# Altium project EVLSERVO1_control_v2.PrjPcb (part 8 of 9)
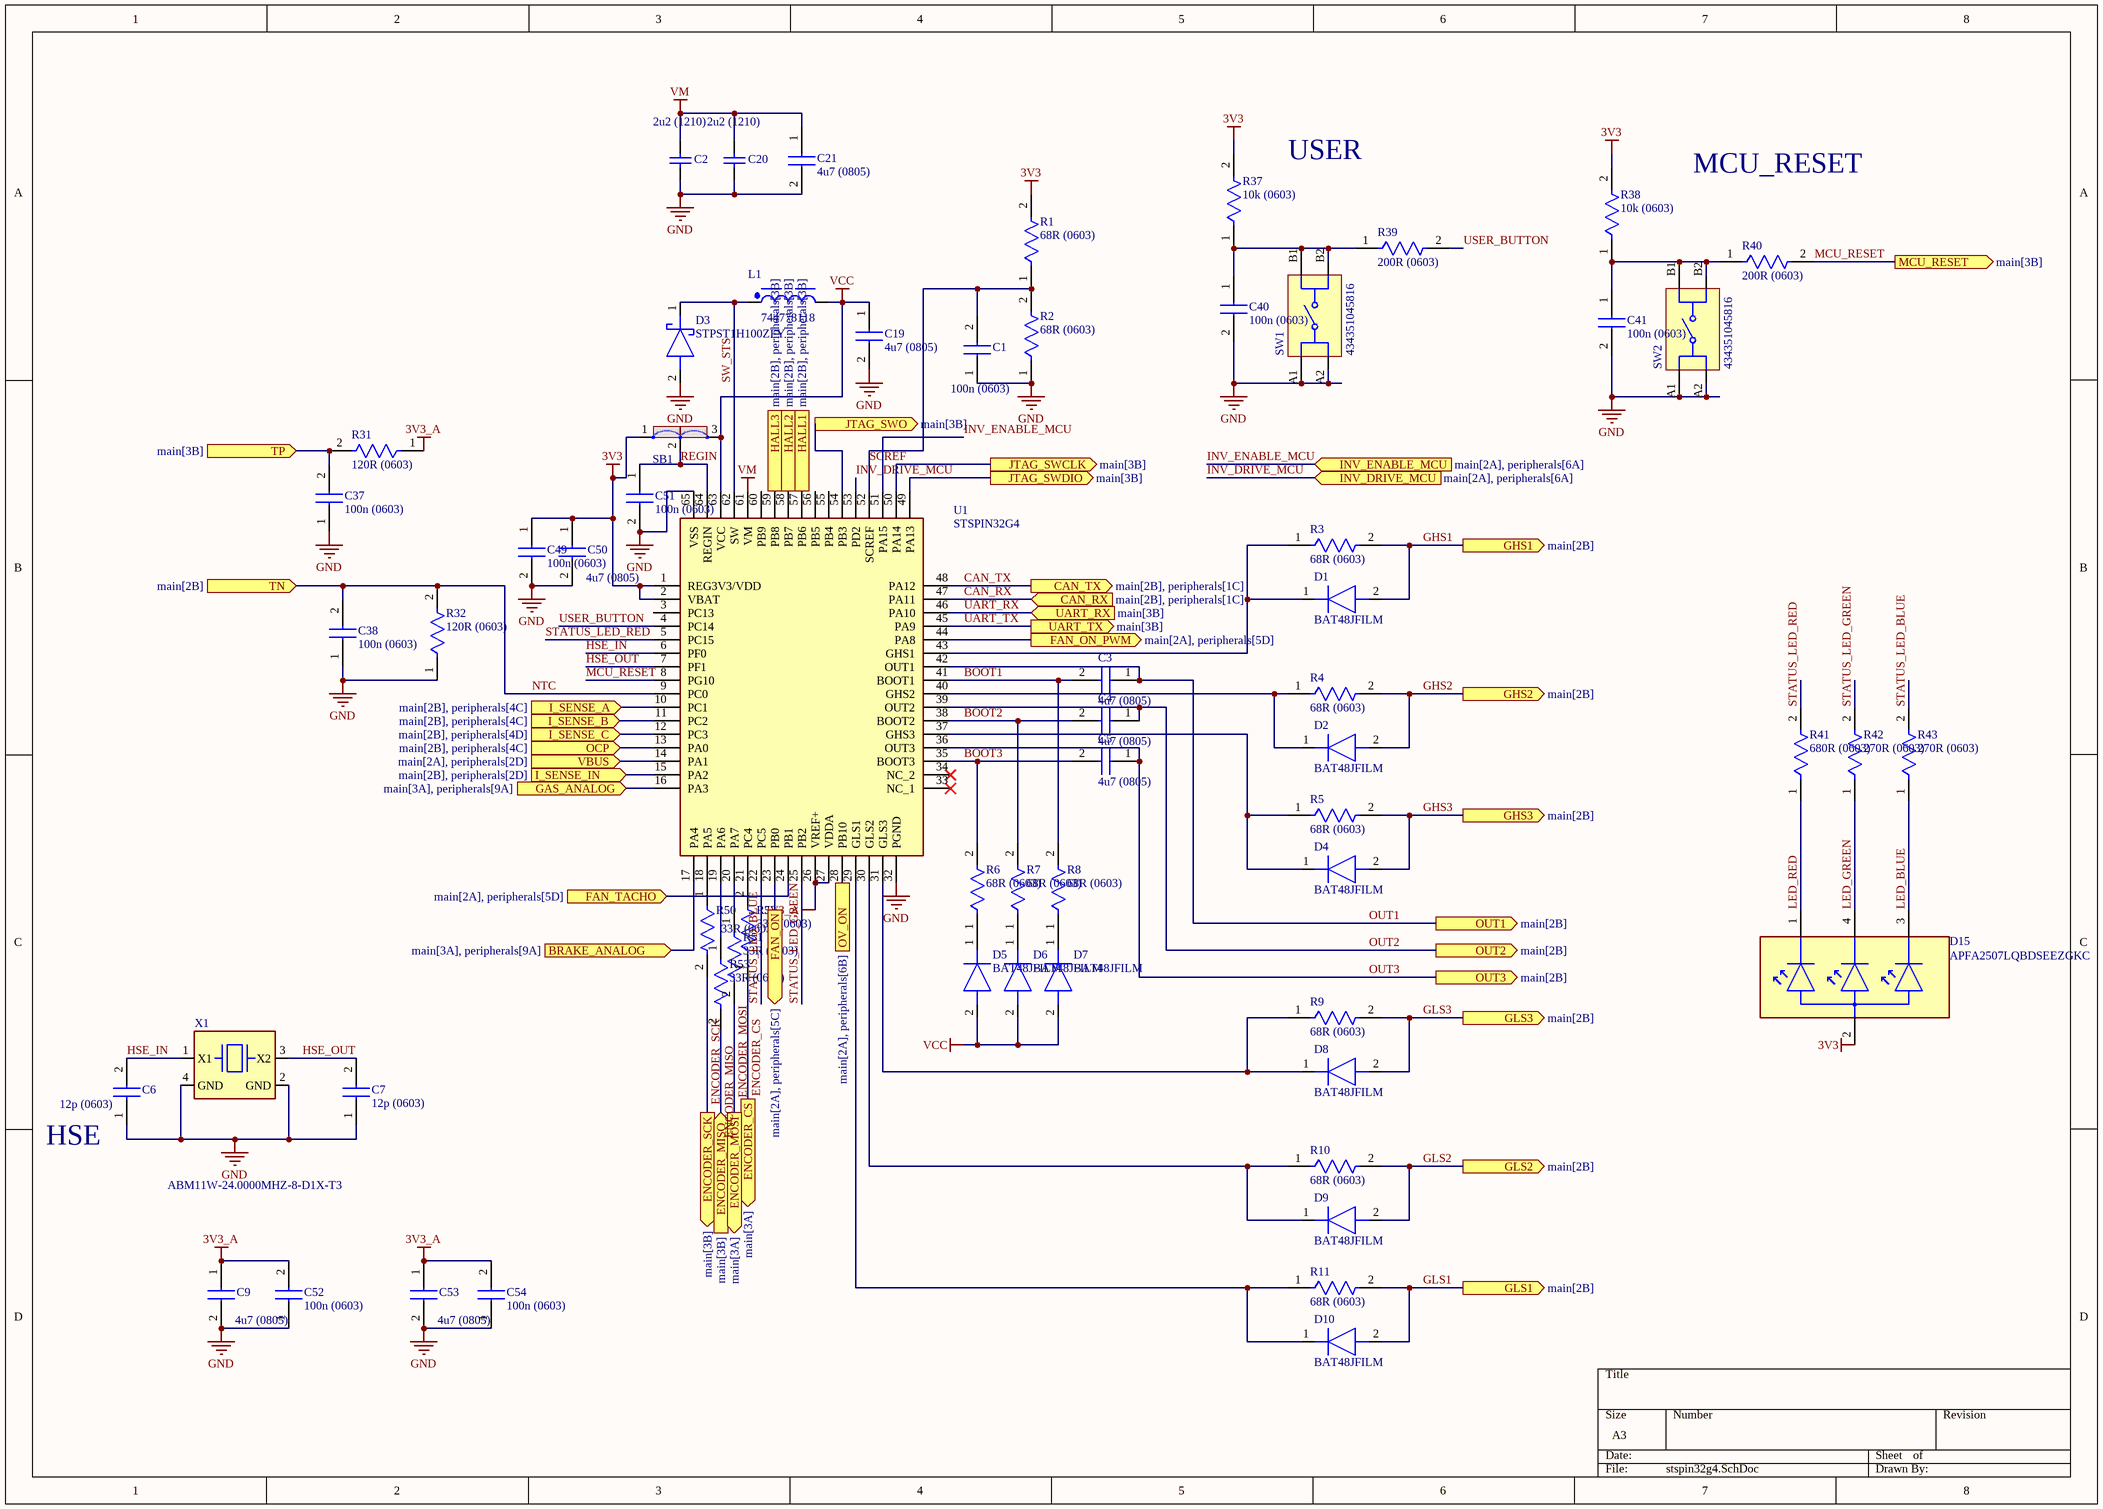
[diagram p11: stspin32g4.SchDoc]

## Sheet stspin32g4.SchDoc (continued)

### Library data of the parts (continued)
R37 R38 = CRCW060310K0FKEA: Fixed Resistor, Metal Glaze/Thick Film, 0.1W, 10000ohm, 75V, 1% +/-Tol, Surface Mount, 0603; Manufacturer_Name: Yageo Group; Manufacturer_Part_Number: SR0603FR-7T10KL; Power Rating: 250mW; Value: 10kΩ; Temperature Coefficient: 100ppm/°C; Working Voltage: 150V; Max Power Dissipation: 100mW; Datasheet Link: https://mouser.componentsearchengine.com/Datasheets/1/SR0603FR-7T10KL.pdf; Height: 0.55mm; Mouser Part Number: 603-SR0603FR-7T10KL; Mouser Price/Stock: https://www.mouser.co.uk/ProductDetail/YAGEO/SR0603FR-7T10KL?qs=pfd5qewlna6IurLw3u3uRA%3D%3D; Arrow Part Number: SR0603FR-7T10KL; Arrow Price/Stock: https://www.arrow.com/en/products/sr0603fr-7t10kl/yageo; Supplier: DigiKey; Supplier Part Number: YAG5823CT-ND; Manufacturer: Yageo Group; Manufacturer Part Number: SR0603FR-7T10KL; RoHS: Compliant; Category: Chip SMD Resistors; Pricing: 1=0,67, 10=0,399, 25=0,3376, 50=0,3022, 100=0,2744, 250=0,24612, 500=0,22976, 1000=0,21675 (USD); Case/Package: 0603; China RoHS: Non-Compliant; Composition: Thick Film; Country of Origin: Mainland China, Taiwan; Export Control Classification Number (ECCN) Code: EAR99; Harmonized Tariff Schedule (HTS) Code: 8533.21.00.30; Introduction Date: 2017-10-02; Length: 1.6mm; Lifecycle Status: Production; Max Operating Temperature: 155°C; Min Operating Temperature: -55°C; Mounting Technology: Surface Mount; Number of Terminals: 2; Packaging: Tape & Reel; Ratings: AEC-Q200; REACH SVHC: Yes; Tolerance: 1%; Voltage Rating: 75V; Width: 800µm; ComponentLink1URL: https://datasheet.octopart.com:443/SR0603FR-7T10KL-Yageo-datasheet-176402240.pdf?src-supplier=Farnell; ComponentLink1Description: https://datasheet.octopart.com:443/SR0603FR-7T10KL-Yageo-datasheet-176402240.pdf?src-supplier=Farnell; ComponentLink2URL: https://datasheet.octopart.com:443/SR0603FR-7T10KL-Yageo-datasheet-119732217.pdf?src-supplier=Upverter; ComponentLink2Description: https://datasheet.octopart.com:443/SR0603FR-7T10KL-Yageo-datasheet-119732217.pdf?src-supplier=Upverter; ComponentLink3URL: https://datasheet.octopart.com:443/SR0603FR-7T10KL-Yageo-Group-datasheet-184785656.pdf?src-supplier=Future+Electronics; ComponentLink3Description: https://datasheet.octopart.com:443/SR0603FR-7T10KL-Yageo-Group-datasheet-184785656.pdf?src-supplier=Future+Electronics; ComponentLink4URL: https://datasheet.octopart.com:443/SR0603FR-7T10KL-Yageo-datasheet-155675517.pdf?src-supplier=Future+Electronics; ComponentLink4Description: https://datasheet.octopart.com:443/SR0603FR-7T10KL-Yageo-datasheet-155675517.pdf?src-supplier=Future+Electronics; ComponentLink5URL: https://datasheet.octopart.com:443/SR0603FR-7T10KL-Yageo-datasheet-137701088.pdf?src-supplier=Future+Electronics; ComponentLink5Description: https://datasheet.octopart.com:443/SR0603FR-7T10KL-Yageo-datasheet-137701088.pdf?src-supplier=Future+Electronics; ComponentLink6URL: https://datasheet.octopart.com/SR0603FR-7T10KL-Yageo-datasheet-11047080.pdf; ComponentLink6Description: https://datasheet.octopart.com/SR0603FR-7T10KL-Yageo-datasheet-11047080.pdf; ComponentLink7URL: http://sigma.octopart.com:80/conflict_mineral_statement/Yageo-company-3.pdf?src-supplier=Compliance+Statements; ComponentLink7Description: http://sigma.octopart.com:80/conflict_mineral_statement/Yageo-company-3.pdf?src-supplier=Compliance+Statements; ComponentLink8URL: http://sigma.octopart.com:80/rohs_statement/Yageo-company-2.pdf?src-supplier=Compliance+Statements; ComponentLink8Description: http://sigma.octopart.com:80/rohs_statement/Yageo-company-2.pdf?src-supplier=Compliance+Statements; Stock: 5000; ComponentLink9URL: https://datasheet.octopart.com:443/SR0603FR-7T4R7L-Yageo-datasheet-176402240.pdf?src-supplier=Farnell; ComponentLink9Description: https://datasheet.octopart.com:443/SR0603FR-7T4R7L-Yageo-datasheet-176402240.pdf?src-supplier=Farnell; ComponentLink10URL: https://datasheet.octopart.com:443/SR0603FR-7T4R7L-Yageo-datasheet-119732217.pdf?src-supplier=Upverter; ComponentLink10Description: https://datasheet.octopart.com:443/SR0603FR-7T4R7L-Yageo-datasheet-119732217.pdf?src-supplier=Upverter; ComponentLink11URL: https://datasheet.octopart.com:443/SR0603FR-7T4R7L-Yageo-Group-datasheet-184785656.pdf?src-supplier=Future+Electronics; ComponentLink11Description: https://datasheet.octopart.com:443/SR0603FR-7T4R7L-Yageo-Group-datasheet-184785656.pdf?src-supplier=Future+Electronics; ComponentLink12URL: https://datasheet.octopart.com:443/SR0603FR-7T4R7L-Yageo-datasheet-155675517.pdf?src-supplier=Future+Electronics; ComponentLink12Description: https://datasheet.octopart.com:443/SR0603FR-7T4R7L-Yageo-datasheet-155675517.pdf?src-supplier=Future+Electronics; ComponentLink13URL: https://datasheet.octopart.com:443/SR0603FR-7T4R7L-Yageo-datasheet-137701088.pdf?src-supplier=Future+Electronics; ComponentLink13Description: https://datasheet.octopart.com:443/SR0603FR-7T4R7L-Yageo-datasheet-137701088.pdf?src-supplier=Future+Electronics; ComponentLink14URL: https://datasheet.octopart.com/SR0603FR-7T4R7L-Yageo-datasheet-11047080.pdf; ComponentLink14Description: https://datasheet.octopart.com/SR0603FR-7T4R7L-Yageo-datasheet-11047080.pdf; Schedule B: 8533210045, 8533210045|8533210045|8533210045|8533210045|8533210045; ComponentLink15URL: https://datasheet.octopart.com:443/SR0603FR-7T100KL-Yageo-datasheet-176402240.pdf?src-supplier=element14+APAC; ComponentLink15Description: https://datasheet.octopart.com:443/SR0603FR-7T100KL-Yageo-datasheet-176402240.pdf?src-supplier=element14+APAC; ComponentLink16URL: https://datasheet.octopart.com:443/SR0603FR-7T100KL-Yageo-datasheet-119732217.pdf?src-supplier=Upverter; ComponentLink16Description: https://datasheet.octopart.com:443/SR0603FR-7T100KL-Yageo-datasheet-119732217.pdf?src-supplier=Upverter; ComponentLink17URL: https://datasheet.octopart.com:443/SR0603FR-7T100KL-Yageo-Group-datasheet-184785656.pdf?src-supplier=Future+Electronics; ComponentLink17Description: https://datasheet.octopart.com:443/SR0603FR-7T100KL-Yageo-Group-datasheet-184785656.pdf?src-supplier=Future+Electronics; ComponentLink18URL: https://datasheet.octopart.com:443/SR0603FR-7T100KL-Yageo-datasheet-155675517.pdf?src-supplier=Future+Electronics; ComponentLink18Description: https://datasheet.octopart.com:443/SR0603FR-7T100KL-Yageo-datasheet-155675517.pdf?src-supplier=Future+Electronics; ComponentLink19URL: https://datasheet.octopart.com:443/SR0603FR-7T100KL-Yageo-datasheet-137701088.pdf?src-supplier=Future+Electronics; ComponentLink19Description: https://datasheet.octopart.com:443/SR0603FR-7T100KL-Yageo-datasheet-137701088.pdf?src-supplier=Future+Electronics; ComponentLink20URL: https://datasheet.octopart.com/SR0603FR-7T100KL-Yageo-datasheet-11047080.pdf; ComponentLink20Description: https://datasheet.octopart.com/SR0603FR-7T100KL-Yageo-datasheet-11047080.pdf; Case Code (Imperial): 0603; Contact Plating: Lead, Tin; Depth: 850µm; Features: Automotive AEC-Q200; Lead Free: Lead Free; Military Standard: Not; Pins: 2; Number of Terminations: 2; Radiation Hardening: No; Termination: SMD/SMT; Voltage Rating (DC): 75V; Weight: 2.012816mg; ComponentLink21URL: https://datasheet.octopart.com:443/CRCW060310K0FKEA-Vishay-datasheet-175423584.pdf?src-supplier=IHS; ComponentLink21Description: https://datasheet.octopart.com:443/CRCW060310K0FKEA-Vishay-datasheet-175423584.pdf?src-supplier=IHS; ComponentLink22URL: https://datasheet.octopart.com:443/CRCW060310K0FKEA-Vishay-datasheet-5300368.pdf?src-supplier=Future+Electronics; ComponentLink22Description: https://datasheet.octopart.com:443/CRCW060310K0FKEA-Vishay-datasheet-5300368.pdf?src-supplier=Future+Electronics; ComponentLink23URL: https://datasheet.octopart.com:443/CRCW060310K0FKEA-Vishay-datasheet-62316122.pdf?src-supplier=Future+Electronics; ComponentLink23Description: https://datasheet.octopart.com:443/CRCW060310K0FKEA-Vishay-datasheet-62316122.pdf?src-supplier=Future+Electronics; ComponentLink24URL: https://datasheet.octopart.com:443/CRCW060310K0FKEA-Vishay-datasheet-141434677.pdf?src-supplier=Upverter; ComponentLink24Description: https://datasheet.octopart.com:443/CRCW060310K0FKEA-Vishay-datasheet-141434677.pdf?src-supplier=Upverter; ComponentLink25URL: https://datasheet.octopart.com:443/CRCW060310K0FKEA-Vishay-datasheet-83961561.pdf?src-supplier=Newark; ComponentLink25Description: https://datasheet.octopart.com:443/CRCW060310K0FKEA-Vishay-datasheet-83961561.pdf?src-supplier=Newark; ComponentLink26URL: https://datasheet.octopart.com:443/CRCW060310K0FKEA-Vishay-datasheet-14722531.pdf?src-supplier=Newark; ComponentLink26Description: https://datasheet.octopart.com:443/CRCW060310K0FKEA-Vishay-datasheet-14722531.pdf?src-supplier=Newark; ComponentLink27URL: https://datasheet.octopart.com:443/CRCW060310K0FKEA-Vishay-datasheet-11516975.pdf?src-supplier=Newark; ComponentLink27Description: https://datasheet.octopart.com:443/CRCW060310K0FKEA-Vishay-datasheet-11516975.pdf?src-supplier=Newark; ComponentLink28URL: https://datasheet.octopart.com:443/CRCW060310K0FKEA-Vishay-datasheet-41302739.pdf?src-supplier=Newark; ComponentLink28Description: https://datasheet.octopart.com:443/CRCW060310K0FKEA-Vishay-datasheet-41302739.pdf?src-supplier=Newark; ComponentLink29URL: https://datasheet.octopart.com:443/CRCW060310K0FKEA-Vishay-datasheet-33013972.pdf?src-supplier=Newark; ComponentLink29Description: https://datasheet.octopart.com:443/CRCW060310K0FKEA-Vishay-datasheet-33013972.pdf?src-supplier=Newark; ComponentLink30URL: https://datasheet.octopart.com:443/CRCW060310K0FKEA-Vishay-datasheet-21226360.pdf?src-supplier=Newark; ComponentLink30Description: https://datasheet.octopart.com:443/CRCW060310K0FKEA-Vishay-datasheet-21226360.pdf?src-supplier=Newark; ComponentLink31URL: https://datasheet.octopart.com:443/CRCW060310K0FKEA-Vishay-datasheet-62317933.pdf?src-supplier=element14+APAC; ComponentLink31Description: https://datasheet.octopart.com:443/CRCW060310K0FKEA-Vishay-datasheet-62317933.pdf?src-supplier=element14+APAC; ComponentLink32URL: https://datasheet.octopart.com:443/CRCW060310K0FKEA-Vishay-datasheet-16179825.pdf?src-supplier=element14+APAC; ComponentLink32Description: https://datasheet.octopart.com:443/CRCW060310K0FKEA-Vishay-datasheet-16179825.pdf?src-supplier=element14+APAC; ComponentLink33URL: https://datasheet.octopart.com:443/CRCW060310K0FKEA-Vishay-datasheet-66077789.pdf?src-supplier=element14+APAC; ComponentLink33Description: https://datasheet.octopart.com:443/CRCW060310K0FKEA-Vishay-datasheet-66077789.pdf?src-supplier=element14+APAC; ComponentLink34URL: https://datasheet.octopart.com:443/CRCW060310K0FKEA-Vishay-datasheet-5306405.pdf?src-supplier=RS+(Formerly+Allied+Electronics); ComponentLink34Description: https://datasheet.octopart.com:443/CRCW060310K0FKEA-Vishay-datasheet-5306405.pdf?src-supplier=RS+(Formerly+Allied+Electronics); ComponentLink35URL: https://datasheet.octopart.com:443/CRCW060310K0FKEA-Vishay-Dale-datasheet-47688880.pdf?src-supplier=RS+(Formerly+Allied+Electronics); ComponentLink35Description: https://datasheet.octopart.com:443/CRCW060310K0FKEA-Vishay-Dale-datasheet-47688880.pdf?src-supplier=RS+(Formerly+Allied+Electronics); ComponentLink36URL: https://datasheet.octopart.com:443/CRCW060310K0FKEA-Vishay-datasheet-12001583.pdf?src-supplier=RS+(Formerly+Allied+Electronics); ComponentLink36Description: https://datasheet.octopart.com:443/CRCW060310K0FKEA-Vishay-datasheet-12001583.pdf?src-supplier=RS+(Formerly+Allied+Electronics); ComponentLink37URL: https://datasheet.octopart.com:443/CRCW060310K0FKEA-Vishay-datasheet-17834126.pdf?src-supplier=TME; ComponentLink37Description: https://datasheet.octopart.com:443/CRCW060310K0FKEA-Vishay-datasheet-17834126.pdf?src-supplier=TME; ComponentLink38URL: https://datasheet.octopart.com/D-CRCW-e3-Standard-Thick-Film-Chip-Resistors-Vishay-datasheet-family-64.pdf; ComponentLink38Description: https://datasheet.octopart.com/D-CRCW-e3-Standard-Thick-Film-Chip-Resistors-Vishay-datasheet-family-64.pdf; ComponentLink39URL: https://datasheet.octopart.com:443/CRCW060310K0FKEA-Vishay-datasheet-13242068.pdf?src-supplier=Farnell; ComponentLink39Description: https://datasheet.octopart.com:443/CRCW060310K0FKEA-Vishay-datasheet-13242068.pdf?src-supplier=Farnell; ComponentLink40URL: https://datasheet.octopart.com:443/CRCW060310K0FKEA-Vishay-datasheet-13195083.pdf?src-supplier=Farnell; ComponentLink40Description: https://datasheet.octopart.com:443/CRCW060310K0FKEA-Vishay-datasheet-13195083.pdf?src-supplier=Farnell; ComponentLink41URL: https://datasheet.octopart.com:443/CRCW060310K0FKEA-Vishay-datasheet-13034211.pdf?src-supplier=Farnell; ComponentLink41Description: https://datasheet.octopart.com:443/CRCW060310K0FKEA-Vishay-datasheet-13034211.pdf?src-supplier=Farnell; ComponentLink42URL: https://datasheet.octopart.com:443/CRCW060310K0FKEA-Vishay-datasheet-12600034.pdf?src-supplier=Farnell; ComponentLink42Description: https://datasheet.octopart.com:443/CRCW060310K0FKEA-Vishay-datasheet-12600034.pdf?src-supplier=Farnell; ComponentLink43URL: https://datasheet.octopart.com:443/CRCW060310K0FKEA-Vishay-datasheet-12532161.pdf?src-supplier=Farnell; ComponentLink43Description: https://datasheet.octopart.com:443/CRCW060310K0FKEA-Vishay-datasheet-12532161.pdf?src-supplier=Farnell; ComponentLink44URL: https://datasheet.octopart.com:443/CRCW060310K0FKEA-Vishay-datasheet-12517896.pdf?src-supplier=Farnell; ComponentLink44Description: https://datasheet.octopart.com:443/CRCW060310K0FKEA-Vishay-datasheet-12517896.pdf?src-supplier=Farnell; ComponentLink45URL: https://datasheet.octopart.com:443/CRCW060310K0FKEA-Vishay-datasheet-12509762.pdf?src-supplier=Farnell; ComponentLink45Description: https://datasheet.octopart.com:443/CRCW060310K0FKEA-Vishay-datasheet-12509762.pdf?src-supplier=Farnell; ComponentLink46URL: https://datasheet.octopart.com:443/CRCW060310K0FKEA-Vishay-datasheet-10322335.pdf?src-supplier=Farnell; ComponentLink46Description: https://datasheet.octopart.com:443/CRCW060310K0FKEA-Vishay-datasheet-10322335.pdf?src-supplier=Farnell; ComponentLink47URL: https://datasheet.octopart.com:443/CRCW060310K0FKEA-Vishay-datasheet-8788789.pdf?src-supplier=Farnell; ComponentLink47Description: https://datasheet.octopart.com:443/CRCW060310K0FKEA-Vishay-datasheet-8788789.pdf?src-supplier=Farnell; ComponentLink48URL: https://datasheet.octopart.com:443/CRCW060310K0FKEA-Vishay-datasheet-8361388.pdf?src-supplier=Farnell; ComponentLink48Description: https://datasheet.octopart.com:443/CRCW060310K0FKEA-Vishay-datasheet-8361388.pdf?src-supplier=Farnell; ComponentLink49URL: https://datasheet.octopart.com:443/CRCW060310K0FKEA-Vishay-datasheet-546287.pdf?src-supplier=Farnell; ComponentLink49Description: https://datasheet.octopart.com:443/CRCW060310K0FKEA-Vishay-datasheet-546287.pdf?src-supplier=Farnell; ComponentLink50URL: https://datasheet.octopart.com:443/CRCW060310K0FKEA-Vishay-datasheet-8619608.pdf?src-supplier=element14; ComponentLink50Description: https://datasheet.octopart.com:443/CRCW060310K0FKEA-Vishay-datasheet-8619608.pdf?src-supplier=element14; ComponentLink51URL: https://datasheet.octopart.com:443/CRCW060310K0FKEA-Vishay-datasheet-5377433.pdf?src-supplier=Garrett; ComponentLink51Description: https://datasheet.octopart.com:443/CRCW060310K0FKEA-Vishay-datasheet-5377433.pdf?src-supplier=Garrett; ComponentLink52URL: https://datasheet.octopart.com:443/CRCW060310K0FKEA-Vishay-datasheet-148188.pdf?src-supplier=Garrett; ComponentLink52Description: https://datasheet.octopart.com:443/CRCW060310K0FKEA-Vishay-datasheet-148188.pdf?src-supplier=Garrett; ComponentLink53URL: https://datasheet.octopart.com:443/CRCW060310K0FKEA-Vishay-datasheet-30224.pdf?src-supplier=Garrett; ComponentLink53Description: https://datasheet.octopart.com:443/CRCW060310K0FKEA-Vishay-datasheet-30224.pdf?src-supplier=Garrett; ComponentLink54URL: https://datasheet.octopart.com:443/CRCW060310K0FKEA-Vishay-datasheet-11835177.pdf?src-supplier=Arrow+Electronics; ComponentLink54Description: https://datasheet.octopart.com:443/CRCW060310K0FKEA-Vishay-datasheet-11835177.pdf?src-supplier=Arrow+Electronics; ComponentLink55URL: http://sigma.octopart.com:80/rohs_certificate/D-CRCW-e3-Standard-Thick-Film-Chip-Resistors-Vishay-family-102.pdf?src-supplier=Compliance+Statements; ComponentLink55Description: http://sigma.octopart.com:80/rohs_certificate/D-CRCW-e3-Standard-Thick-Film-Chip-Resistors-Vishay-family-102.pdf?src-supplier=Compliance+Statements
R41 = RK73H1JTTD6800F: Res Thick Film 0603 680 Ohm 1% 0.125W(1/8W) ±100ppm/C Pad SMD Automotive T/R; Manufacturer_Name: Yageo Group; Manufacturer_Part_Number: SR0603FR-7T10KL; Power Rating: 250mW; Value: 10kΩ; Temperature Coefficient: 100ppm/°C; Voltage Rating: 75V; Working Voltage: 150V; Voltage Rating (DC): 50V; Max Power Dissipation: 125mW; Datasheet Link: https://mouser.componentsearchengine.com/Datasheets/1/SR0603FR-7T10KL.pdf; Height: 0.55mm; Mouser Part Number: 603-SR0603FR-7T10KL; Mouser Price/Stock: https://www.mouser.co.uk/ProductDetail/YAGEO/SR0603FR-7T10KL?qs=pfd5qewlna6IurLw3u3uRA%3D%3D; Arrow Part Number: SR0603FR-7T10KL; Arrow Price/Stock: https://www.arrow.com/en/products/sr0603fr-7t10kl/yageo; Supplier: DigiKey; Supplier Part Number: YAG5823CT-ND; Manufacturer: Yageo Group; Manufacturer Part Number: SR0603FR-7T10KL; RoHS: Compliant; Category: Chip SMD Resistors; Pricing: 1=0,67, 10=0,399, 25=0,3376, 50=0,3022, 100=0,2744, 250=0,24612, 500=0,22976, 1000=0,21675 (USD); Case/Package: 0603; China RoHS: Non-Compliant; Composition: Thick Film; Country of Origin: Mainland China, Taiwan; Export Control Classification Number (ECCN) Code: EAR99; Harmonized Tariff Schedule (HTS) Code: 8533.21.00.30; Introduction Date: 2017-10-02; Length: 1.6mm; Lifecycle Status: Production; Max Operating Temperature: 155°C; Min Operating Temperature: -55°C; Mounting Technology: Surface Mount; Number of Terminals: 2; Packaging: Tape & Reel; Ratings: AEC-Q200; REACH SVHC: Yes; Tolerance: 1%; Width: 800µm; ComponentLink1URL: https://datasheet.octopart.com:443/SR0603FR-7T10KL-Yageo-datasheet-176402240.pdf?src-supplier=Farnell; ComponentLink1Description: https://datasheet.octopart.com:443/SR0603FR-7T10KL-Yageo-datasheet-176402240.pdf?src-supplier=Farnell; ComponentLink2URL: https://datasheet.octopart.com:443/SR0603FR-7T10KL-Yageo-datasheet-119732217.pdf?src-supplier=Upverter; ComponentLink2Description: https://datasheet.octopart.com:443/SR0603FR-7T10KL-Yageo-datasheet-119732217.pdf?src-supplier=Upverter; ComponentLink3URL: https://datasheet.octopart.com:443/SR0603FR-7T10KL-Yageo-Group-datasheet-184785656.pdf?src-supplier=Future+Electronics; ComponentLink3Description: https://datasheet.octopart.com:443/SR0603FR-7T10KL-Yageo-Group-datasheet-184785656.pdf?src-supplier=Future+Electronics; ComponentLink4URL: https://datasheet.octopart.com:443/SR0603FR-7T10KL-Yageo-datasheet-155675517.pdf?src-supplier=Future+Electronics; ComponentLink4Description: https://datasheet.octopart.com:443/SR0603FR-7T10KL-Yageo-datasheet-155675517.pdf?src-supplier=Future+Electronics; ComponentLink5URL: https://datasheet.octopart.com:443/SR0603FR-7T10KL-Yageo-datasheet-137701088.pdf?src-supplier=Future+Electronics; ComponentLink5Description: https://datasheet.octopart.com:443/SR0603FR-7T10KL-Yageo-datasheet-137701088.pdf?src-supplier=Future+Electronics; ComponentLink6URL: https://datasheet.octopart.com/SR0603FR-7T10KL-Yageo-datasheet-11047080.pdf; ComponentLink6Description: https://datasheet.octopart.com/SR0603FR-7T10KL-Yageo-datasheet-11047080.pdf; ComponentLink7URL: http://sigma.octopart.com:80/conflict_mineral_statement/Yageo-company-3.pdf?src-supplier=Compliance+Statements; ComponentLink7Description: http://sigma.octopart.com:80/conflict_mineral_statement/Yageo-company-3.pdf?src-supplier=Compliance+Statements; ComponentLink8URL: http://sigma.octopart.com:80/rohs_statement/Yageo-company-2.pdf?src-supplier=Compliance+Statements; ComponentLink8Description: http://sigma.octopart.com:80/rohs_statement/Yageo-company-2.pdf?src-supplier=Compliance+Statements; Stock: 5000; ComponentLink9URL: https://datasheet.octopart.com:443/SR0603FR-7T4R7L-Yageo-datasheet-176402240.pdf?src-supplier=Farnell; ComponentLink9Description: https://datasheet.octopart.com:443/SR0603FR-7T4R7L-Yageo-datasheet-176402240.pdf?src-supplier=Farnell; ComponentLink10URL: https://datasheet.octopart.com:443/SR0603FR-7T4R7L-Yageo-datasheet-119732217.pdf?src-supplier=Upverter; ComponentLink10Description: https://datasheet.octopart.com:443/SR0603FR-7T4R7L-Yageo-datasheet-119732217.pdf?src-supplier=Upverter; ComponentLink11URL: https://datasheet.octopart.com:443/SR0603FR-7T4R7L-Yageo-Group-datasheet-184785656.pdf?src-supplier=Future+Electronics; ComponentLink11Description: https://datasheet.octopart.com:443/SR0603FR-7T4R7L-Yageo-Group-datasheet-184785656.pdf?src-supplier=Future+Electronics; ComponentLink12URL: https://datasheet.octopart.com:443/SR0603FR-7T4R7L-Yageo-datasheet-155675517.pdf?src-supplier=Future+Electronics; ComponentLink12Description: https://datasheet.octopart.com:443/SR0603FR-7T4R7L-Yageo-datasheet-155675517.pdf?src-supplier=Future+Electronics; ComponentLink13URL: https://datasheet.octopart.com:443/SR0603FR-7T4R7L-Yageo-datasheet-137701088.pdf?src-supplier=Future+Electronics; ComponentLink13Description: https://datasheet.octopart.com:443/SR0603FR-7T4R7L-Yageo-datasheet-137701088.pdf?src-supplier=Future+Electronics; ComponentLink14URL: https://datasheet.octopart.com/SR0603FR-7T4R7L-Yageo-datasheet-11047080.pdf; ComponentLink14Description: https://datasheet.octopart.com/SR0603FR-7T4R7L-Yageo-datasheet-11047080.pdf; Max Voltage Rating (DC): 150V; ComponentLink15URL: https://datasheet.octopart.com:443/SG73G1JTTD5102C-KOA-Speer-datasheet-181956059.pdf?src-supplier=IHS; ComponentLink15Description: https://datasheet.octopart.com:443/SG73G1JTTD5102C-KOA-Speer-datasheet-181956059.pdf?src-supplier=IHS; ComponentLink16URL: https://sigma.octopart.com:443/141350679/technical_drawing/KOA-Speer-SG73G1JTTD5102C.pdf?src-supplier=KOA+Speer+SCT; ComponentLink16Description: https://sigma.octopart.com:443/141350679/technical_drawing/KOA-Speer-SG73G1JTTD5102C.pdf?src-supplier=KOA+Speer+SCT; ComponentLink17URL: https://datasheet.octopart.com:443/SG73G1JTTD5102C-KOA-Speer-datasheet-141350755.pdf?src-supplier=KOA+Speer+SCT; ComponentLink17Description: https://datasheet.octopart.com:443/SG73G1JTTD5102C-KOA-Speer-datasheet-141350755.pdf?src-supplier=KOA+Speer+SCT; ComponentLink18URL: http://sigma.octopart.com:80/rohs_statement/KOA-Speer-company-17.pdf?src-supplier=Compliance+Statements; ComponentLink18Description: http://sigma.octopart.com:80/rohs_statement/KOA-Speer-company-17.pdf?src-supplier=Compliance+Statements; ComponentLink19URL: https://datasheet.octopart.com:443/ESR03EZPD5102-ROHM-datasheet-182147624.pdf?src-supplier=IHS; ComponentLink19Description: https://datasheet.octopart.com:443/ESR03EZPD5102-ROHM-datasheet-182147624.pdf?src-supplier=IHS; Case Code (Imperial): 0603; Case Code (Metric): 1608; Depth: 800µm; Lead Free: Lead Free; Military Standard: Not; Schedule B: 8533210045, 8533210045|8533210045, 8533210045|8533210045|8533210045, 8533210045|8533210045|8533210045|8533210045; Termination: SMD/SMT; ComponentLink20URL: https://datasheet.octopart.com:443/RK73H1JTTD68R0F-KOA-Speer-datasheet-181956035.pdf?src-supplier=IHS; ComponentLink20Description: https://datasheet.octopart.com:443/RK73H1JTTD68R0F-KOA-Speer-datasheet-181956035.pdf?src-supplier=IHS; ComponentLink21URL: https://datasheet.octopart.com:443/RK73H1JTTD68R0F-KOA-Speer-datasheet-11590619.pdf?src-supplier=Upverter; ComponentLink21Description: https://datasheet.octopart.com:443/RK73H1JTTD68R0F-KOA-Speer-datasheet-11590619.pdf?src-supplier=Upverter; ComponentLink22URL: https://datasheet.octopart.com:443/RK73H1JTTD68R0F-KOA-Speer-datasheet-149653815.pdf?src-supplier=Newark; ComponentLink22Description: https://datasheet.octopart.com:443/RK73H1JTTD68R0F-KOA-Speer-datasheet-149653815.pdf?src-supplier=Newark; ComponentLink23URL: https://datasheet.octopart.com:443/RK73H1JTTD68R0F-KOA-Speer-datasheet-10854116.pdf?src-supplier=element14+APAC; ComponentLink23Description: https://datasheet.octopart.com:443/RK73H1JTTD68R0F-KOA-Speer-datasheet-10854116.pdf?src-supplier=element14+APAC; Contact Plating: Tin; Features: Anti-Sulfur, Moisture Resistant; Number of Terminations: 2; Radiation Hardening: No; ComponentLink24URL: https://datasheet.octopart.com:443/RNCP0603FTD10K0-Stackpole-Electronics-datasheet-182148179.pdf?src-supplier=IHS; ComponentLink24Description: https://datasheet.octopart.com:443/RNCP0603FTD10K0-Stackpole-Electronics-datasheet-182148179.pdf?src-supplier=IHS; ComponentLink25URL: https://datasheet.octopart.com:443/RNCP0603FTD10K0-Stackpole-Electronics-datasheet-141193801.pdf?src-supplier=Upverter; ComponentLink25Description: https://datasheet.octopart.com:443/RNCP0603FTD10K0-Stackpole-Electronics-datasheet-141193801.pdf?src-supplier=Upverter; ComponentLink26URL: https://datasheet.octopart.com:443/RNCP0603FTD10K0-Stackpole-Electronics-datasheet-38896780.pdf?src-supplier=Upverter; ComponentLink26Description: https://datasheet.octopart.com:443/RNCP0603FTD10K0-Stackpole-Electronics-datasheet-38896780.pdf?src-supplier=Upverter; ComponentLink27URL: https://datasheet.octopart.com:443/RNCP0603FTD10K0-Stackpole-Electronics-datasheet-149178200.pdf?src-supplier=Upverter; ComponentLink27Description: https://datasheet.octopart.com:443/RNCP0603FTD10K0-Stackpole-Electronics-datasheet-149178200.pdf?src-supplier=Upverter; ComponentLink28URL: https://datasheet.octopart.com:443/RNCP0603FTD10K0-Stackpole-Electronics-datasheet-33021030.pdf?src-supplier=Future+Electronics; ComponentLink28Description: https://datasheet.octopart.com:443/RNCP0603FTD10K0-Stackpole-Electronics-datasheet-33021030.pdf?src-supplier=Future+Electronics; ComponentLink29URL: http://sigma.octopart.com:80/15942470/materials_sheet/Stackpole-Electronics-RNCP0603FTD10K0.pdf?src-supplier=Compliance+Statements; ComponentLink29Description: http://sigma.octopart.com:80/15942470/materials_sheet/Stackpole-Electronics-RNCP0603FTD10K0.pdf?src-supplier=Compliance+Statements; ComponentLink30URL: http://sigma.octopart.com:80/141158212/rohs_statement/Stackpole-Electronics-RNCP0603FTD10K0.pdf?src-supplier=Compliance+Statements; ComponentLink30Description: http://sigma.octopart.com:80/141158212/rohs_statement/Stackpole-Electronics-RNCP0603FTD10K0.pdf?src-supplier=Compliance+Statements; ComponentLink31URL: http://sigma.octopart.com:80/141158211/reach_statement/Stackpole-Electronics-RNCP0603FTD10K0.pdf?src-supplier=Compliance+Statements; ComponentLink31Description: http://sigma.octopart.com:80/141158211/reach_statement/Stackpole-Electronics-RNCP0603FTD10K0.pdf?src-supplier=Compliance+Statements; ComponentLink32URL: https://datasheet.octopart.com:443/RK73H1JTTD6800F-KOA-Speer-datasheet-181956035.pdf?src-supplier=IHS; ComponentLink32Description: https://datasheet.octopart.com:443/RK73H1JTTD6800F-KOA-Speer-datasheet-181956035.pdf?src-supplier=IHS; ComponentLink33URL: https://datasheet.octopart.com:443/RK73H1JTTD6800F-KOA-Speer-datasheet-11590619.pdf?src-supplier=Upverter; ComponentLink33Description: https://datasheet.octopart.com:443/RK73H1JTTD6800F-KOA-Speer-datasheet-11590619.pdf?src-supplier=Upverter; ComponentLink34URL: https://datasheet.octopart.com:443/RK73H1JTTD6800F-KOA-Speer-datasheet-141913736.pdf?src-supplier=Upverter; ComponentLink34Description: https://datasheet.octopart.com:443/RK73H1JTTD6800F-KOA-Speer-datasheet-141913736.pdf?src-supplier=Upverter; ComponentLink35URL: https://datasheet.octopart.com:443/RK73H1JTTD6800F-KOA-Speer-datasheet-149653815.pdf?src-supplier=Newark; ComponentLink35Description: https://datasheet.octopart.com:443/RK73H1JTTD6800F-KOA-Speer-datasheet-149653815.pdf?src-supplier=Newark; ComponentLink36URL: https://datasheet.octopart.com:443/RK73H1JTTD6800F-KOA-Speer-datasheet-11541643.pdf?src-supplier=Arrow+Electronics; ComponentLink36Description: https://datasheet.octopart.com:443/RK73H1JTTD6800F-KOA-Speer-datasheet-11541643.pdf?src-supplier=Arrow+Electronics; ComponentLink37URL: https://datasheet.octopart.com:443/RK73H1JTTD6800F-KOA-Speer-datasheet-10854116.pdf?src-supplier=element14+APAC; ComponentLink37Description: https://datasheet.octopart.com:443/RK73H1JTTD6800F-KOA-Speer-datasheet-10854116.pdf?src-supplier=element14+APAC
R42 R43 = RK73H1JTTD2700F: Res Thick Film 0603 270 Ohm 1% 0.125W(1/8W) ±100ppm/C Pad SMD Automotive T/R; Manufacturer_Name: Yageo Group; Manufacturer_Part_Number: SR0603FR-7T10KL; Power Rating: 250mW; Value: 10kΩ; Temperature Coefficient: 100ppm/°C; Voltage Rating: 75V; Working Voltage: 150V; Voltage Rating (DC): 50V; Max Power Dissipation: 125mW; Datasheet Link: https://mouser.componentsearchengine.com/Datasheets/1/SR0603FR-7T10KL.pdf; Height: 0.55mm; Mouser Part Number: 603-SR0603FR-7T10KL; Mouser Price/Stock: https://www.mouser.co.uk/ProductDetail/YAGEO/SR0603FR-7T10KL?qs=pfd5qewlna6IurLw3u3uRA%3D%3D; Arrow Part Number: SR0603FR-7T10KL; Arrow Price/Stock: https://www.arrow.com/en/products/sr0603fr-7t10kl/yageo; Supplier: DigiKey; Supplier Part Number: YAG5823CT-ND; Manufacturer: Yageo Group; Manufacturer Part Number: SR0603FR-7T10KL; RoHS: Compliant; Category: Chip SMD Resistors; Pricing: 1=0,67, 10=0,399, 25=0,3376, 50=0,3022, 100=0,2744, 250=0,24612, 500=0,22976, 1000=0,21675 (USD); Case/Package: 0603; China RoHS: Non-Compliant; Composition: Thick Film; Country of Origin: Mainland China, Taiwan; Export Control Classification Number (ECCN) Code: EAR99; Harmonized Tariff Schedule (HTS) Code: 8533.21.00.30; Introduction Date: 2017-10-02; Length: 1.6mm; Lifecycle Status: Production; Max Operating Temperature: 155°C; Min Operating Temperature: -55°C; Mounting Technology: Surface Mount; Number of Terminals: 2; Packaging: Tape & Reel; Ratings: AEC-Q200; REACH SVHC: Yes; Tolerance: 1%; Width: 800µm; ComponentLink1URL: https://datasheet.octopart.com:443/SR0603FR-7T10KL-Yageo-datasheet-176402240.pdf?src-supplier=Farnell; ComponentLink1Description: https://datasheet.octopart.com:443/SR0603FR-7T10KL-Yageo-datasheet-176402240.pdf?src-supplier=Farnell; ComponentLink2URL: https://datasheet.octopart.com:443/SR0603FR-7T10KL-Yageo-datasheet-119732217.pdf?src-supplier=Upverter; ComponentLink2Description: https://datasheet.octopart.com:443/SR0603FR-7T10KL-Yageo-datasheet-119732217.pdf?src-supplier=Upverter; ComponentLink3URL: https://datasheet.octopart.com:443/SR0603FR-7T10KL-Yageo-Group-datasheet-184785656.pdf?src-supplier=Future+Electronics; ComponentLink3Description: https://datasheet.octopart.com:443/SR0603FR-7T10KL-Yageo-Group-datasheet-184785656.pdf?src-supplier=Future+Electronics; ComponentLink4URL: https://datasheet.octopart.com:443/SR0603FR-7T10KL-Yageo-datasheet-155675517.pdf?src-supplier=Future+Electronics; ComponentLink4Description: https://datasheet.octopart.com:443/SR0603FR-7T10KL-Yageo-datasheet-155675517.pdf?src-supplier=Future+Electronics; ComponentLink5URL: https://datasheet.octopart.com:443/SR0603FR-7T10KL-Yageo-datasheet-137701088.pdf?src-supplier=Future+Electronics; ComponentLink5Description: https://datasheet.octopart.com:443/SR0603FR-7T10KL-Yageo-datasheet-137701088.pdf?src-supplier=Future+Electronics; ComponentLink6URL: https://datasheet.octopart.com/SR0603FR-7T10KL-Yageo-datasheet-11047080.pdf; ComponentLink6Description: https://datasheet.octopart.com/SR0603FR-7T10KL-Yageo-datasheet-11047080.pdf; ComponentLink7URL: http://sigma.octopart.com:80/conflict_mineral_statement/Yageo-company-3.pdf?src-supplier=Compliance+Statements; ComponentLink7Description: http://sigma.octopart.com:80/conflict_mineral_statement/Yageo-company-3.pdf?src-supplier=Compliance+Statements; ComponentLink8URL: http://sigma.octopart.com:80/rohs_statement/Yageo-company-2.pdf?src-supplier=Compliance+Statements; ComponentLink8Description: http://sigma.octopart.com:80/rohs_statement/Yageo-company-2.pdf?src-supplier=Compliance+Statements; Stock: 5000; ComponentLink9URL: https://datasheet.octopart.com:443/SR0603FR-7T4R7L-Yageo-datasheet-176402240.pdf?src-supplier=Farnell; ComponentLink9Description: https://datasheet.octopart.com:443/SR0603FR-7T4R7L-Yageo-datasheet-176402240.pdf?src-supplier=Farnell; ComponentLink10URL: https://datasheet.octopart.com:443/SR0603FR-7T4R7L-Yageo-datasheet-119732217.pdf?src-supplier=Upverter; ComponentLink10Description: https://datasheet.octopart.com:443/SR0603FR-7T4R7L-Yageo-datasheet-119732217.pdf?src-supplier=Upverter; ComponentLink11URL: https://datasheet.octopart.com:443/SR0603FR-7T4R7L-Yageo-Group-datasheet-184785656.pdf?src-supplier=Future+Electronics; ComponentLink11Description: https://datasheet.octopart.com:443/SR0603FR-7T4R7L-Yageo-Group-datasheet-184785656.pdf?src-supplier=Future+Electronics; ComponentLink12URL: https://datasheet.octopart.com:443/SR0603FR-7T4R7L-Yageo-datasheet-155675517.pdf?src-supplier=Future+Electronics; ComponentLink12Description: https://datasheet.octopart.com:443/SR0603FR-7T4R7L-Yageo-datasheet-155675517.pdf?src-supplier=Future+Electronics; ComponentLink13URL: https://datasheet.octopart.com:443/SR0603FR-7T4R7L-Yageo-datasheet-137701088.pdf?src-supplier=Future+Electronics; ComponentLink13Description: https://datasheet.octopart.com:443/SR0603FR-7T4R7L-Yageo-datasheet-137701088.pdf?src-supplier=Future+Electronics; ComponentLink14URL: https://datasheet.octopart.com/SR0603FR-7T4R7L-Yageo-datasheet-11047080.pdf; ComponentLink14Description: https://datasheet.octopart.com/SR0603FR-7T4R7L-Yageo-datasheet-11047080.pdf; Max Voltage Rating (DC): 150V; ComponentLink15URL: https://datasheet.octopart.com:443/SG73G1JTTD5102C-KOA-Speer-datasheet-181956059.pdf?src-supplier=IHS; ComponentLink15Description: https://datasheet.octopart.com:443/SG73G1JTTD5102C-KOA-Speer-datasheet-181956059.pdf?src-supplier=IHS; ComponentLink16URL: https://sigma.octopart.com:443/141350679/technical_drawing/KOA-Speer-SG73G1JTTD5102C.pdf?src-supplier=KOA+Speer+SCT; ComponentLink16Description: https://sigma.octopart.com:443/141350679/technical_drawing/KOA-Speer-SG73G1JTTD5102C.pdf?src-supplier=KOA+Speer+SCT; ComponentLink17URL: https://datasheet.octopart.com:443/SG73G1JTTD5102C-KOA-Speer-datasheet-141350755.pdf?src-supplier=KOA+Speer+SCT; ComponentLink17Description: https://datasheet.octopart.com:443/SG73G1JTTD5102C-KOA-Speer-datasheet-141350755.pdf?src-supplier=KOA+Speer+SCT; ComponentLink18URL: http://sigma.octopart.com:80/rohs_statement/KOA-Speer-company-17.pdf?src-supplier=Compliance+Statements; ComponentLink18Description: http://sigma.octopart.com:80/rohs_statement/KOA-Speer-company-17.pdf?src-supplier=Compliance+Statements; ComponentLink19URL: https://datasheet.octopart.com:443/ESR03EZPD5102-ROHM-datasheet-182147624.pdf?src-supplier=IHS; ComponentLink19Description: https://datasheet.octopart.com:443/ESR03EZPD5102-ROHM-datasheet-182147624.pdf?src-supplier=IHS; Case Code (Imperial): 0603; Case Code (Metric): 1608; Depth: 800µm; Lead Free: Lead Free; Military Standard: Not; Schedule B: 8533210045, 8533210045|8533210045, 8533210045|8533210045|8533210045, 8533210045|8533210045|8533210045|8533210045; Termination: SMD/SMT; ComponentLink20URL: https://datasheet.octopart.com:443/RK73H1JTTD68R0F-KOA-Speer-datasheet-181956035.pdf?src-supplier=IHS; ComponentLink20Description: https://datasheet.octopart.com:443/RK73H1JTTD68R0F-KOA-Speer-datasheet-181956035.pdf?src-supplier=IHS; ComponentLink21URL: https://datasheet.octopart.com:443/RK73H1JTTD68R0F-KOA-Speer-datasheet-11590619.pdf?src-supplier=Upverter; ComponentLink21Description: https://datasheet.octopart.com:443/RK73H1JTTD68R0F-KOA-Speer-datasheet-11590619.pdf?src-supplier=Upverter; ComponentLink22URL: https://datasheet.octopart.com:443/RK73H1JTTD68R0F-KOA-Speer-datasheet-149653815.pdf?src-supplier=Newark; ComponentLink22Description: https://datasheet.octopart.com:443/RK73H1JTTD68R0F-KOA-Speer-datasheet-149653815.pdf?src-supplier=Newark; ComponentLink23URL: https://datasheet.octopart.com:443/RK73H1JTTD68R0F-KOA-Speer-datasheet-10854116.pdf?src-supplier=element14+APAC; ComponentLink23Description: https://datasheet.octopart.com:443/RK73H1JTTD68R0F-KOA-Speer-datasheet-10854116.pdf?src-supplier=element14+APAC; Contact Plating: Tin; Features: Anti-Sulfur, Moisture Resistant; Number of Terminations: 2; Radiation Hardening: No; ComponentLink24URL: https://datasheet.octopart.com:443/RNCP0603FTD10K0-Stackpole-Electronics-datasheet-182148179.pdf?src-supplier=IHS; ComponentLink24Description: https://datasheet.octopart.com:443/RNCP0603FTD10K0-Stackpole-Electronics-datasheet-182148179.pdf?src-supplier=IHS; ComponentLink25URL: https://datasheet.octopart.com:443/RNCP0603FTD10K0-Stackpole-Electronics-datasheet-141193801.pdf?src-supplier=Upverter; ComponentLink25Description: https://datasheet.octopart.com:443/RNCP0603FTD10K0-Stackpole-Electronics-datasheet-141193801.pdf?src-supplier=Upverter; ComponentLink26URL: https://datasheet.octopart.com:443/RNCP0603FTD10K0-Stackpole-Electronics-datasheet-38896780.pdf?src-supplier=Upverter; ComponentLink26Description: https://datasheet.octopart.com:443/RNCP0603FTD10K0-Stackpole-Electronics-datasheet-38896780.pdf?src-supplier=Upverter; ComponentLink27URL: https://datasheet.octopart.com:443/RNCP0603FTD10K0-Stackpole-Electronics-datasheet-149178200.pdf?src-supplier=Upverter; ComponentLink27Description: https://datasheet.octopart.com:443/RNCP0603FTD10K0-Stackpole-Electronics-datasheet-149178200.pdf?src-supplier=Upverter; ComponentLink28URL: https://datasheet.octopart.com:443/RNCP0603FTD10K0-Stackpole-Electronics-datasheet-33021030.pdf?src-supplier=Future+Electronics; ComponentLink28Description: https://datasheet.octopart.com:443/RNCP0603FTD10K0-Stackpole-Electronics-datasheet-33021030.pdf?src-supplier=Future+Electronics; ComponentLink29URL: http://sigma.octopart.com:80/15942470/materials_sheet/Stackpole-Electronics-RNCP0603FTD10K0.pdf?src-supplier=Compliance+Statements; ComponentLink29Description: http://sigma.octopart.com:80/15942470/materials_sheet/Stackpole-Electronics-RNCP0603FTD10K0.pdf?src-supplier=Compliance+Statements; ComponentLink30URL: http://sigma.octopart.com:80/141158212/rohs_statement/Stackpole-Electronics-RNCP0603FTD10K0.pdf?src-supplier=Compliance+Statements; ComponentLink30Description: http://sigma.octopart.com:80/141158212/rohs_statement/Stackpole-Electronics-RNCP0603FTD10K0.pdf?src-supplier=Compliance+Statements; ComponentLink31URL: http://sigma.octopart.com:80/141158211/reach_statement/Stackpole-Electronics-RNCP0603FTD10K0.pdf?src-supplier=Compliance+Statements; ComponentLink31Description: http://sigma.octopart.com:80/141158211/reach_statement/Stackpole-Electronics-RNCP0603FTD10K0.pdf?src-supplier=Compliance+Statements; ComponentLink32URL: https://datasheet.octopart.com:443/RK73H1JTTD2700F-KOA-Speer-datasheet-181956035.pdf?src-supplier=IHS; ComponentLink32Description: https://datasheet.octopart.com:443/RK73H1JTTD2700F-KOA-Speer-datasheet-181956035.pdf?src-supplier=IHS; ComponentLink33URL: https://datasheet.octopart.com/RK73H1JTTD2700F-KOA-Speer-datasheet-11590619.pdf; ComponentLink33Description: https://datasheet.octopart.com/RK73H1JTTD2700F-KOA-Speer-datasheet-11590619.pdf; ComponentLink34URL: https://datasheet.octopart.com:443/RK73H1JTTD2700F-KOA-Speer-datasheet-149653815.pdf?src-supplier=Newark; ComponentLink34Description: https://datasheet.octopart.com:443/RK73H1JTTD2700F-KOA-Speer-datasheet-149653815.pdf?src-supplier=Newark; ComponentLink35URL: https://datasheet.octopart.com:443/RK73H1JTTD2700F-KOA-Speer-datasheet-188906116.pdf?src-supplier=TME; ComponentLink35Description: https://datasheet.octopart.com:443/RK73H1JTTD2700F-KOA-Speer-datasheet-188906116.pdf?src-supplier=TME; ComponentLink36URL: https://datasheet.octopart.com:443/RK73H1JTTD2700F-KOA-Speer-datasheet-155997623.pdf?src-supplier=LKR; ComponentLink36Description: https://datasheet.octopart.com:443/RK73H1JTTD2700F-KOA-Speer-datasheet-155997623.pdf?src-supplier=LKR